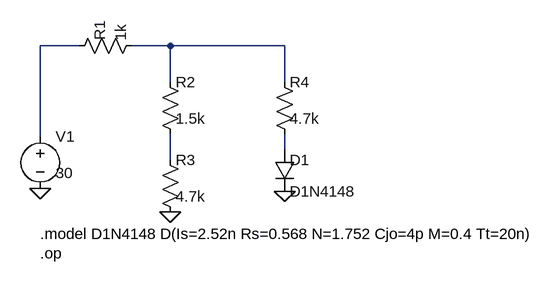
[diagram p0: schematic Ex05.asc]
Ex05.asc, the LTspice schematic file:
Version 4
SHEET 1 880 680
WIRE 60 200 60 60
WIRE 60 60 120 60
WIRE 200 60 260 60
WIRE 260 60 260 116
WIRE 260 60 436 60
WIRE 436 60 436 116
WIRE 260 196 260 236
WIRE 436 196 436 220
FLAG 60 280 0
FLAG 260 316 0
FLAG 436 284 0
SYMBOL voltage 60 184 R0
WINDOW 0 24 16 Left 2
WINDOW 3 24 72 Left 2
SYMATTR InstName V1
SYMATTR Value 30
SYMBOL res 104 76 R270
WINDOW 0 24 48 Left 2
WINDOW 3 24 80 Left 2
SYMATTR InstName R1
SYMATTR Value 1k
SYMBOL res 244 100 R0
WINDOW 0 24 16 Left 2
WINDOW 3 24 72 Left 2
SYMATTR InstName R2
SYMATTR Value 1.5k
SYMBOL res 244 220 R0
WINDOW 0 24 16 Left 2
WINDOW 3 24 72 Left 2
SYMATTR InstName R3
SYMATTR Value 4.7k
SYMBOL res 420 100 R0
WINDOW 0 24 16 Left 2
WINDOW 3 24 72 Left 2
SYMATTR InstName R4
SYMATTR Value 4.7k
SYMBOL diode 420 220 R0
WINDOW 0 24 16 Left 2
WINDOW 3 24 64 Left 2
SYMATTR InstName D1
SYMATTR Value D1N4148
TEXT 60 350 Left 2 !.model D1N4148 D(Is=2.52n Rs=0.568 N=1.752 Cjo=4p M=0.4 Tt=20n)
TEXT 60 380 Left 2 !.op

The netlist it stands for:
* Ex05.asc
V1 N001 0 30
R1 N001 N002 1k
R2 N002 N003 1.5k
R3 N003 0 4.7k
R4 N002 N004 4.7k
D1 N004 0 D1N4148
.model D D
.lib standard.dio
.model D1N4148 D(Is=2.52n Rs=0.568 N=1.752 Cjo=4p M=0.4 Tt=20n)
.op
.backanno
.end